# Altium schematic sheet 11_Audio.SchDoc
size 508 x 381 mm; SheetNumber: 11; SheetTotal: 16
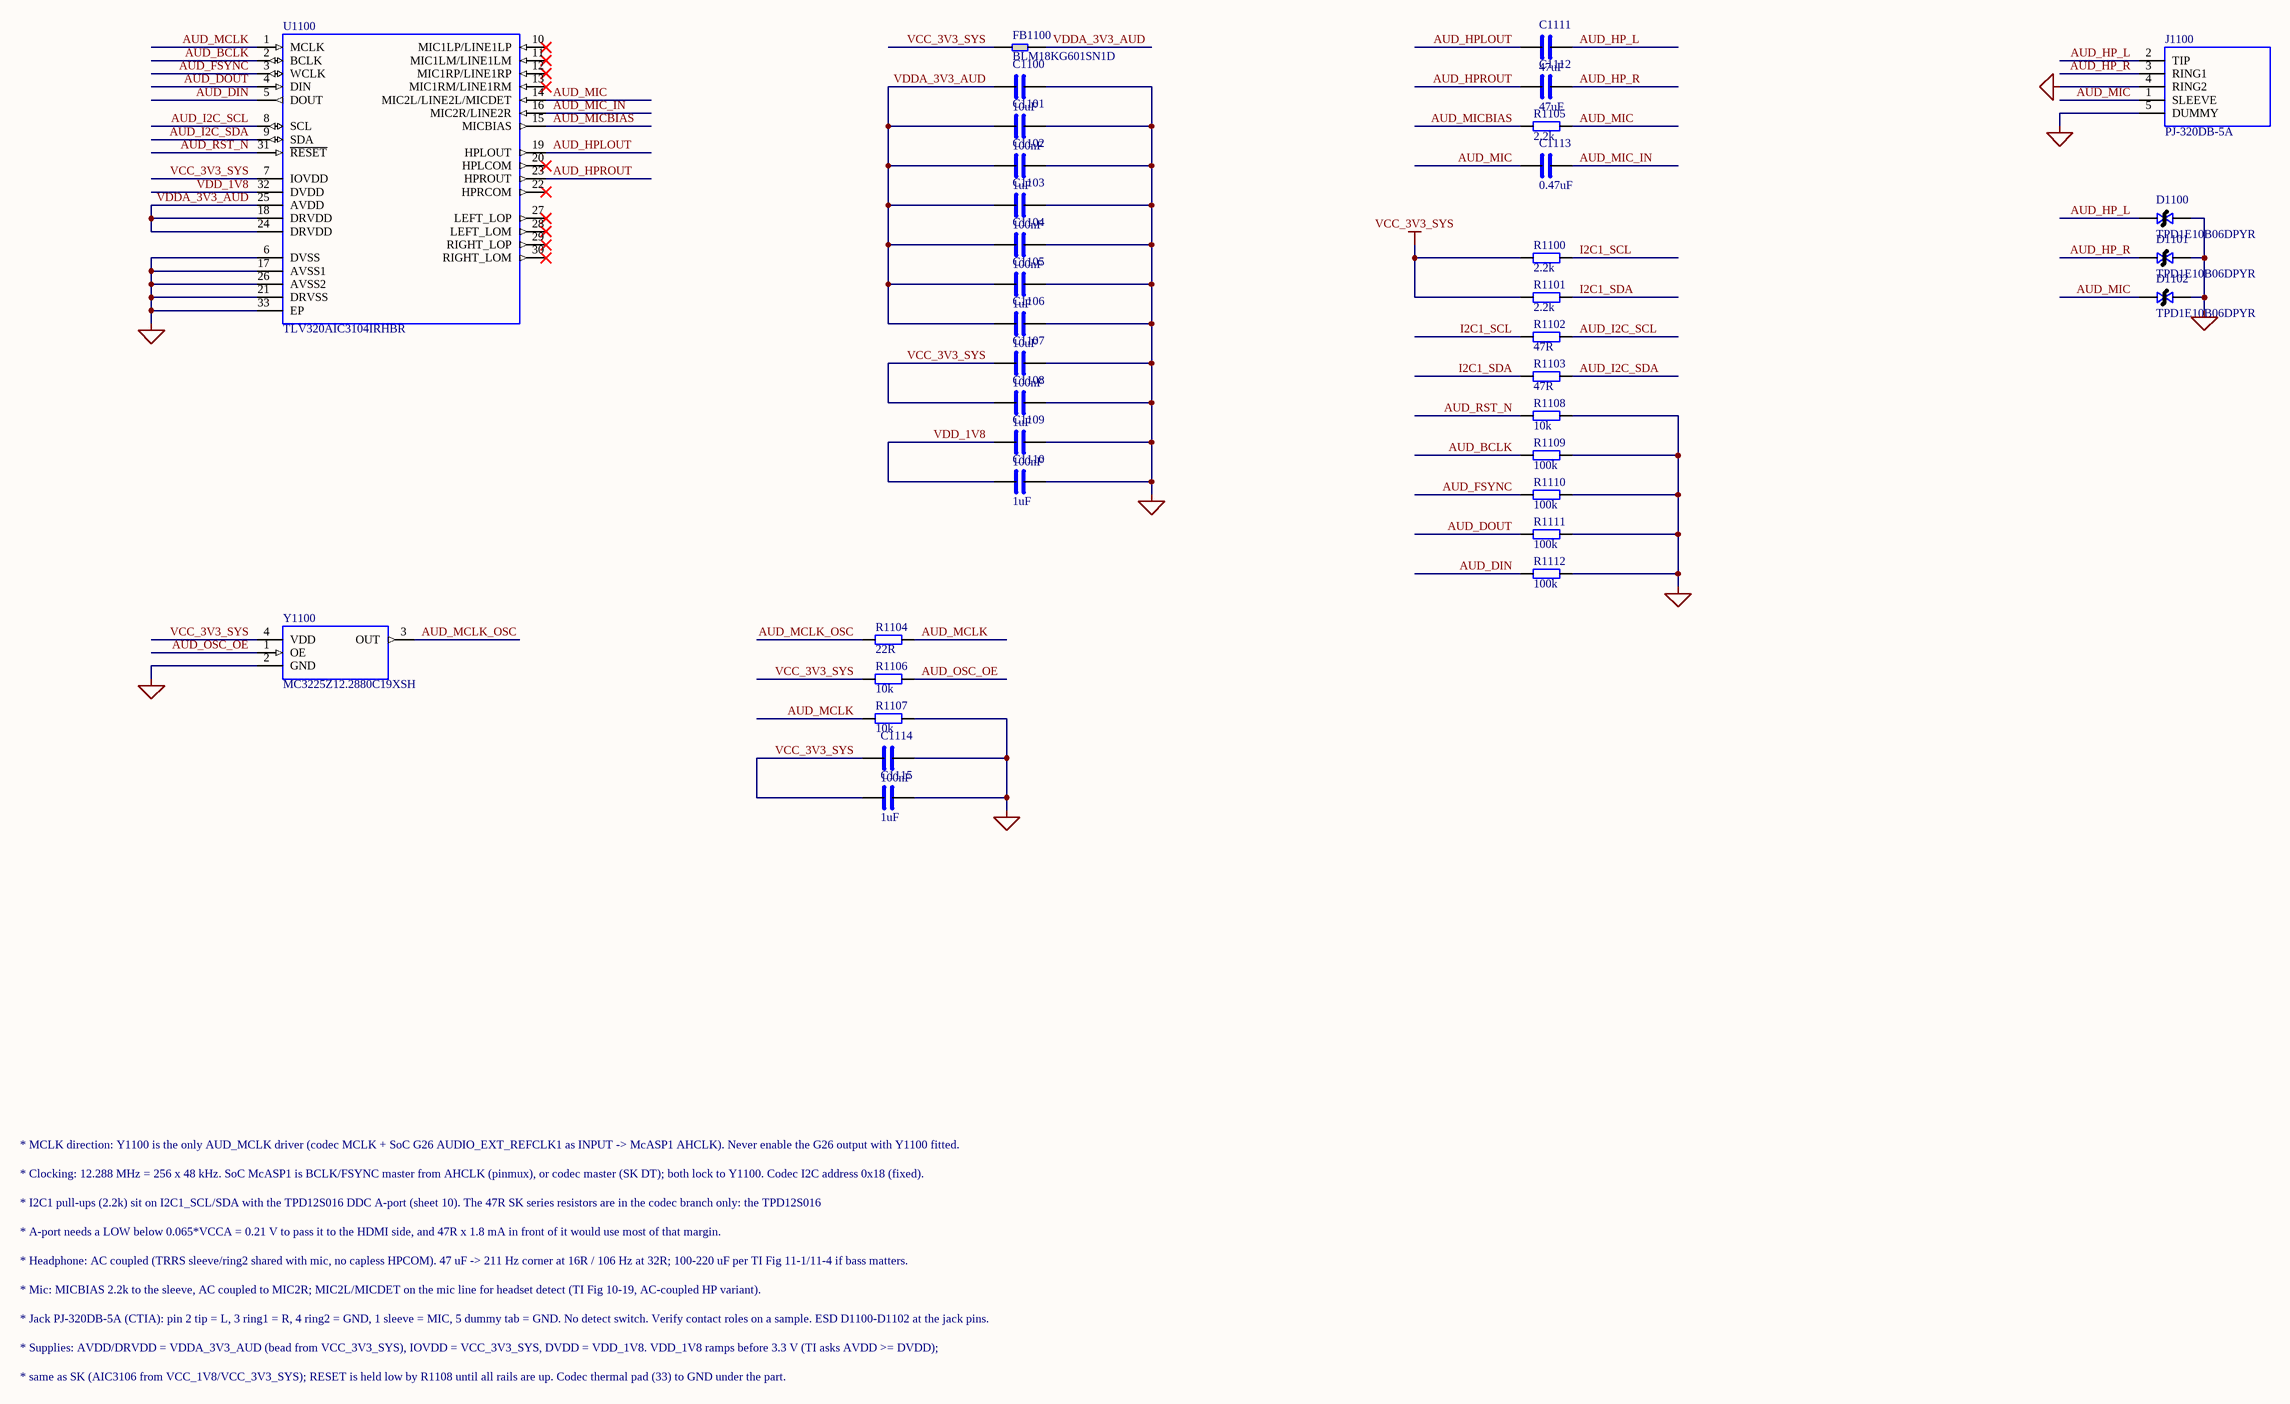
[diagram p0: 11_Audio.SchDoc]

## Parts
C1100  10uF  [C0603]
C1101  100nF  [C0402]
C1102  1uF  [C0402]
C1103  100nF  [C0402]
C1104  100nF  [C0402]
C1105  1uF  [C0402]
C1106  10uF  [C0603]
C1107  100nF  [C0402]
C1108  1uF  [C0402]
C1109  100nF  [C0402]
C1110  1uF  [C0402]
C1111  47uF  [C0805]
C1112  47uF  [C0805]
C1113  0.47uF  [C0402]
C1114  100nF  [C0402]
C1115  1uF  [C0402]
D1100  TPD1E10B06DPYR  [X1SON2_DPY]
D1101  TPD1E10B06DPYR  [X1SON2_DPY]
D1102  TPD1E10B06DPYR  [X1SON2_DPY]
FB1100  BLM18KG601SN1D  [FB0603]
J1100  PJ-320DB-5A  [JACK_HRO_PJ-320DB]
R1100  2.2k  [R0402]
R1101  2.2k  [R0402]
R1102  47R  [R0402]
R1103  47R  [R0402]
R1104  22R  [R0402]
R1105  2.2k  [R0402]
R1106  10k  [R0402]
R1107  10k  [R0402]
R1108  10k  [R0402]
R1109  100k  [R0402]
R1110  100k  [R0402]
R1111  100k  [R0402]
R1112  100k  [R0402]
U1100  TLV320AIC3104IRHBR  [VQFN32_RHB_5X5]
Y1100  MC3225Z12.2880C19XSH  [OSC_3225_4P]

## Nets
GND: C1100.2 C1101.2 C1102.2 C1103.2 C1104.2 C1105.2 C1106.2 C1107.2 C1108.2 C1109.2 C1110.2 C1114.2 C1115.2 D1100.2 D1101.2 D1102.2 J1100.4(RING2) J1100.5(DUMMY) R1107.2 R1108.2 R1109.2 R1110.2 R1111.2 R1112.2 U1100.6(DVSS) U1100.17(AVSS1) U1100.21(DRVSS) U1100.26(AVSS2) U1100.33(EP) Y1100.2(GND)
VCC_3V3_SYS: C1107.1 C1108.1 C1114.1 C1115.1 FB1100.1 R1100.1 R1101.1 R1106.1 U1100.7(IOVDD) Y1100.4(VDD)
AUD_BCLK: R1109.1 U1100.2(BCLK)
AUD_DIN: R1112.1 U1100.5(DOUT)
AUD_DOUT: R1111.1 U1100.4(DIN)
AUD_FSYNC: R1110.1 U1100.3(WCLK)
AUD_HP_L: C1111.2 D1100.1 J1100.2(TIP)
AUD_HP_R: C1112.2 D1101.1 J1100.3(RING1)
AUD_HPLOUT: C1111.1 U1100.19(HPLOUT)
AUD_HPROUT: C1112.1 U1100.23(HPROUT)
AUD_I2C_SCL: R1102.2 U1100.8(SCL)
AUD_I2C_SDA: R1103.2 U1100.9(SDA)
AUD_MCLK: R1104.2 R1107.1 U1100.1(MCLK)
AUD_MCLK_OSC: R1104.1 Y1100.3(OUT)
AUD_MIC: C1113.1 D1102.1 J1100.1(SLEEVE) R1105.2 U1100.14(MIC2L/LINE2L/MICDET)
AUD_MIC_IN: C1113.2 U1100.16(MIC2R/LINE2R)
AUD_MICBIAS: R1105.1 U1100.15(MICBIAS)
AUD_OSC_OE: R1106.2 Y1100.1(OE)
AUD_RST_N: R1108.1 U1100.31(~{RESET})
I2C1_SCL: R1100.2 R1102.1
I2C1_SDA: R1101.2 R1103.1
VDD_1V8: C1109.1 C1110.1 U1100.32(DVDD)
VDDA_3V3_AUD: C1100.1 C1101.1 C1102.1 C1103.1 C1104.1 C1105.1 C1106.1 FB1100.2 U1100.18(DRVDD) U1100.24(DRVDD) U1100.25(AVDD)

Not connected (* = marked no-connect by the designer): U1100 10(MIC1LP/LINE1LP)* 11(MIC1LM/LINE1LM)* 12(MIC1RP/LINE1RP)* 13(MIC1RM/LINE1RM)* 20(HPLCOM)* 22(HPRCOM)* 27(LEFT_LOP)* 28(LEFT_LOM)* 29(RIGHT_LOP)* 30(RIGHT_LOM)*

## Notes on the sheet
- * MCLK direction: Y1100 is the only AUD_MCLK driver (codec MCLK + SoC G26 AUDIO_EXT_REFCLK1 as INPUT -> McASP1 AHCLK). Never enable the G26 output with Y1100 fitted.
- * Clocking: 12.288 MHz = 256 x 48 kHz. SoC McASP1 is BCLK/FSYNC master from AHCLK (pinmux), or codec master (SK DT); both lock to Y1100. Codec I2C address 0x18 (fixed).
- * I2C1 pull-ups (2.2k) sit on I2C1_SCL/SDA with the TPD12S016 DDC A-port (sheet 10). The 47R SK series resistors are in the codec branch only: the TPD12S016
- * A-port needs a LOW below 0.065*VCCA = 0.21 V to pass it to the HDMI side, and 47R x 1.8 mA in front of it would use most of that margin.
- * Headphone: AC coupled (TRRS sleeve/ring2 shared with mic, no capless HPCOM). 47 uF -> 211 Hz corner at 16R / 106 Hz at 32R; 100-220 uF per TI Fig 11-1/11-4 if bass matters.
- * Mic: MICBIAS 2.2k to the sleeve, AC coupled to MIC2R; MIC2L/MICDET on the mic line for headset detect (TI Fig 10-19, AC-coupled HP variant).
- * Jack PJ-320DB-5A (CTIA): pin 2 tip = L, 3 ring1 = R, 4 ring2 = GND, 1 sleeve = MIC, 5 dummy tab = GND. No detect switch. Verify contact roles on a sample. ESD D1100-D1102 at the jack pins.
- * Supplies: AVDD/DRVDD = VDDA_3V3_AUD (bead from VCC_3V3_SYS), IOVDD = VCC_3V3_SYS, DVDD = VDD_1V8. VDD_1V8 ramps before 3.3 V (TI asks AVDD >= DVDD);
- * same as SK (AIC3106 from VCC_1V8/VCC_3V3_SYS); RESET is held low by R1108 until all rails are up. Codec thermal pad (33) to GND under the part.

## Library data of the parts
C1100 = CAP: Capacitor, non-polarized; Spec: 10uF 10V X5R 0603 (bulk after bead)
C1101 = CAP: Capacitor, non-polarized; Spec: 100nF 16V X7R 0402 (AVDD pin 25)
C1102 = CAP: Capacitor, non-polarized; Spec: 1uF 16V X5R 0402 (AVDD pin 25)
C1103 = CAP: Capacitor, non-polarized; Spec: 100nF 16V X7R 0402 (DRVDD pin 18)
C1104 = CAP: Capacitor, non-polarized; Spec: 100nF 16V X7R 0402 (DRVDD pin 24)
C1105 = CAP: Capacitor, non-polarized; Spec: 1uF 16V X5R 0402 (DRVDD)
C1106 = CAP: Capacitor, non-polarized; Spec: 10uF 10V X5R 0603 (DRVDD)
C1107 = CAP: Capacitor, non-polarized; Spec: 100nF 16V X7R 0402 (IOVDD pin 7)
C1108 = CAP: Capacitor, non-polarized; Spec: 1uF 16V X5R 0402 (IOVDD pin 7)
C1109 = CAP: Capacitor, non-polarized; Spec: 100nF 16V X7R 0402 (DVDD pin 32)
C1110 = CAP: Capacitor, non-polarized; Spec: 1uF 16V X5R 0402 (DVDD pin 32)
C1111 = CAP: Capacitor, non-polarized; Spec: 47uF 6.3V X5R 0805 (HP L coupling)
C1112 = CAP: Capacitor, non-polarized; Spec: 47uF 6.3V X5R 0805 (HP R coupling)
C1113 = CAP: Capacitor, non-polarized; Spec: 0.47uF 16V X7R 0402 (mic AC coupling)
C1114 = CAP: Capacitor, non-polarized; Spec: 100nF 16V X7R 0402 (Y1100 VDD)
C1115 = CAP: Capacitor, non-polarized; Spec: 1uF 16V X5R 0402 (Y1100 VDD)
D1100 = TVS_BI: Bidirectional TVS / ESD diode; Manufacturer: Texas Instruments; Spec: TPD1E10B06DPYR (tip, at J1100); MPN: TPD1E10B06DPYR
D1101 = TVS_BI: Bidirectional TVS / ESD diode; Manufacturer: Texas Instruments; Spec: TPD1E10B06DPYR (ring 1, at J1100); MPN: TPD1E10B06DPYR
D1102 = TVS_BI: Bidirectional TVS / ESD diode; Manufacturer: Texas Instruments; Spec: TPD1E10B06DPYR (sleeve, at J1100); MPN: TPD1E10B06DPYR
FB1100 = FERRITE: Ferrite bead; Manufacturer: Murata; Spec: BLM18KG601SN1D 600R@100MHz 1.3A 0603 (codec analog 3.3 V); MPN: BLM18KG601SN1D
J1100 = JACK_TRRS_PJ320DB: 3.5 mm TRRS jack, SMD, no switch (PJ-320DB-5A); Manufacturer: Korean Hroparts Elec; MPN: PJ-320DB-5A
R1100 R1101 = RES: Resistor; Spec: 2.2k 0402 (I2C1 pull-up)
R1102 = RES: Resistor; Spec: 47R 0402 (series, SK R759 practice)
R1103 = RES: Resistor; Spec: 47R 0402 (series, SK R760 practice)
R1104 = RES: Resistor; Spec: 22R 0402 (source series, at Y1100)
R1105 = RES: Resistor; Spec: 2.2k 0402 (MICBIAS feed)
R1106 = RES: Resistor; Spec: 10k 0402 (OE high = run, SK R425)
R1107 = RES: Resistor; Spec: 10k 0402 (MCLK pull-down, SK D-note)
R1108 = RES: Resistor; Spec: 10k 0402 (codec held in reset)
R1109-R1111 = RES: Resistor; Spec: 100k 0402 (pad off in SoC reset)
R1112 = RES: Resistor; Spec: 100k 0402 (codec DOUT Hi-Z in reset)
U1100 = TLV320AIC3104_RHB: TI TLV320AIC3104 low-power stereo codec, I2S + I2C, VQFN-32; Manufacturer: Texas Instruments; MPN: TLV320AIC3104IRHBR
Y1100 = OSC_3225_OE: LVCMOS oscillator with output enable, 3.2x2.5 mm 4-pad; Manufacturer: KYOCERA AVX; Spec: MC3225Z12.2880C19XSH 12.288MHz; MPN: MC3225Z12.2880C19XSH; Supplier: Digi-Key MC3225Z12.2880C19XSH